# Altium project Main_PCB_v1.0.PrjPcb
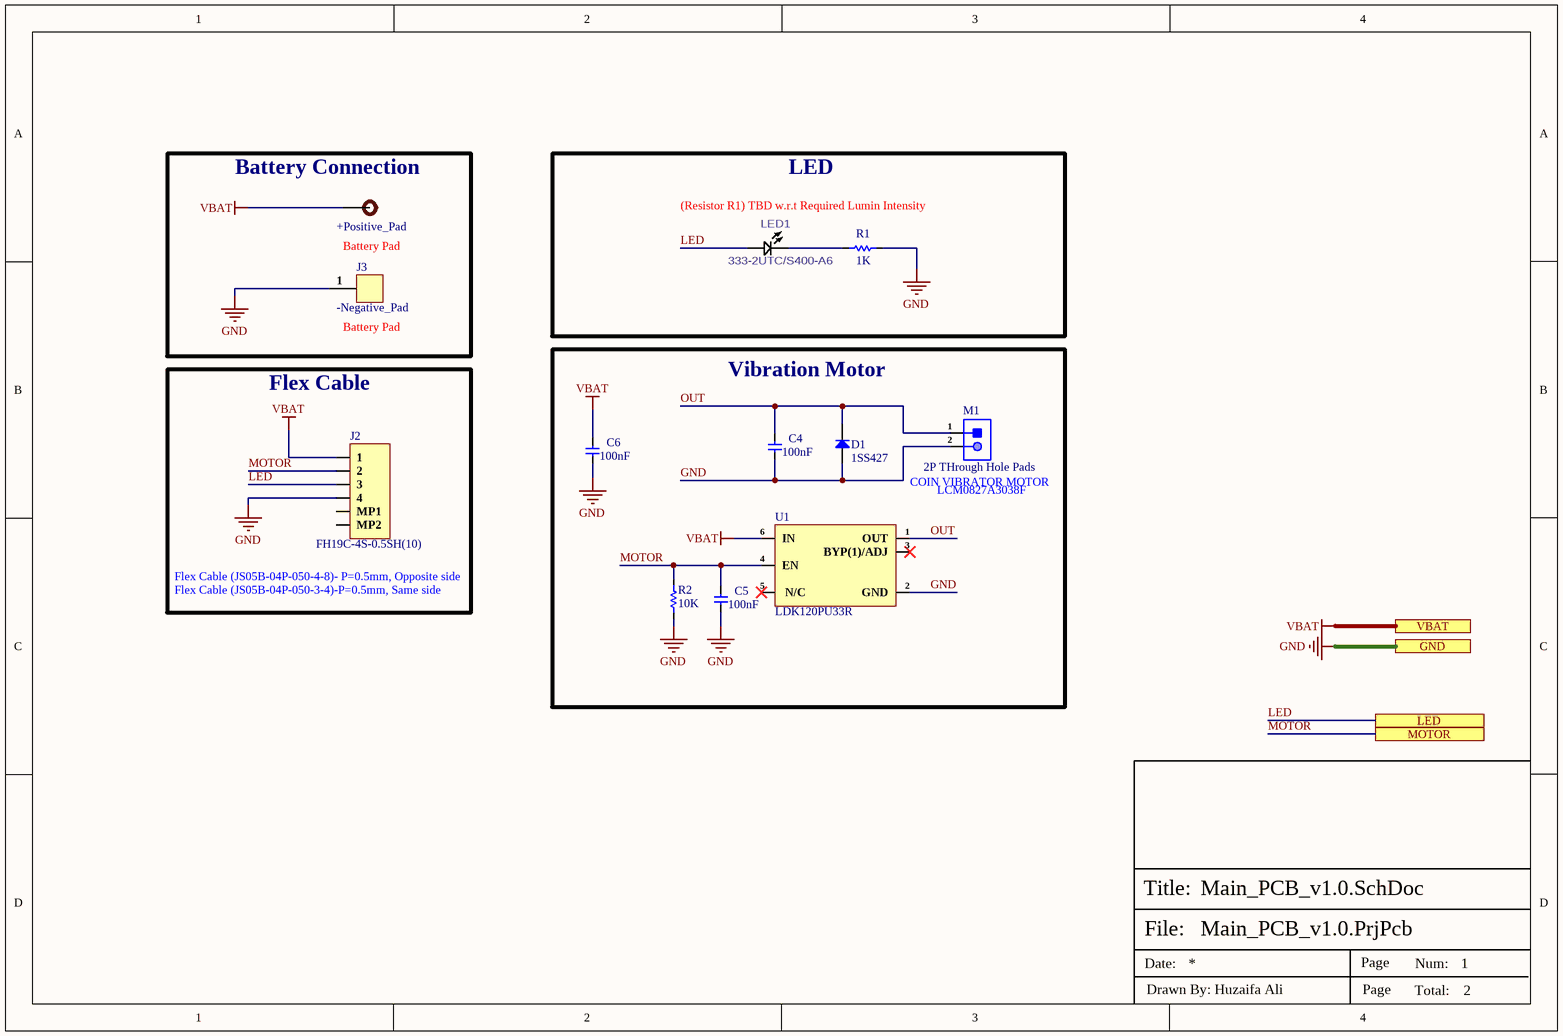
[diagram p0: Main_PCB_v1.0.SchDoc]
1 sheet, 12 parts. Net scope: flat (ports and power ports of the same name join across sheets).
Board file: Main_PCB_v1.0.PcbDoc

## Sheet Main_PCB_v1.0.SchDoc
size A4; SheetNumber: 1; SheetTotal: 2

### Parts
?  +Positive_Pad  [Test-point]
C4  100nF  [CAP-0201]
C5  100nF  [CAP-0201]
C6  100nF  [CAP-0201]
D1  1SS427  [SOD-923.]
J2  FH19C-4S-0.5SH(10)  [FH19C-4S-0.5SH(10)]
J3  -Negative_Pad  [Through Hole Pad (High Power)_]
LED1  333-2UTC/S400-A6  [LED BEND]
M1  2P THrough Hole Pads  [2P THrough Hole Pads]
R1  1K  [Res-0603]
R2  10K  [Res-0201]
U1  LDK120PU33R  [6-DFN (1.2x1.3)]

### Blocks framed on the sheet
Battery Connection: ? J3
LED: LED1 R1
Vibration Motor: C4-C6 D1 M1 R2 U1
Flex Cable: J2

### Ports
GND, LED, MOTOR, VBAT

### Nets
GND: C4.1 C5.1 C6.1 D1.2(A) J2.4 J3.1 M1.2 R1.2 R2.1 U1.2(GND) ; port GND
VBAT: ?.1 C6.2 J2.1 U1.6(IN) ; port VBAT
LED: J2.3 LED1.2(+) ; port LED
MOTOR: C5.2 J2.2 R2.2 U1.4(EN) ; port MOTOR
OUT: C4.2 D1.1(K) M1.1 U1.1(OUT)
NetLED1_1: LED1.1(-) R1.1

Not connected (* = marked no-connect by the designer): J2 MP1 MP2; U1 3(BYP(1)/ADJ)* 5(_N/C)*

### Notes on the sheet
- (near J3) Battery Pad
- (Resistor R1) TBD w.r.t Required Lumin Intensity
- (near M1) COIN VIBRATOR MOTOR
- LCM0827A3038F
- (near J2) Flex Cable (JS05B-04P-050-4-8)- P=0.5mm, Opposite side
- Flex Cable (JS05B-04P-050-3-4)-P=0.5mm, Same side
- File:
- Title:
- Date:
- Page
- Num:
- Total:
- Drawn By: Huzaifa Ali

### Library data of the parts
? = TEST POINT: Test Point ON; Item Type: TEST POINT
C4-C6 = CC0201KRX5R6BB104: CAP CER 0.1UF 10V X5R 0201; Manufacturer: Yageo; Tolerance: 10%; Supplier 1: Mouser; Manufacturer Part Number: CC0201KRX5R6BB104; RoHS: Yes; Category: Ceramic Capacitors; Stock 1: 824403; Pricing 1: 1=0.10000, 10=0.02400, 50=0.02400, 100=0.01900, 1000=0.01100, 10000=0.00900 (USD); Mount: Surface Mount; Case/Package: 0201; Case Code (Imperial): 0201; Case Code (Metric): 0603; Weight: 6E-06oz; Min Operating Temperature: -55°C; Max Operating Temperature: 85°C; Capacitance: 100nF; Packaging: Tape and Reel; Voltage Rating: 10V; Dielectric: X5R; Termination: SMD/SMT; Voltage Rating (DC): 10V; Length: 0.6mm; Width: 0.012inch; Thickness: 0.013inch; Lead Free: Lead Free; Halogen Free: Halogen Free; ComponentLink1URL: https://datasheet.ciiva.com/11587/upy-gphc-x5r-4v-to-50v-12-11587190.pdf?src-supplier=Avnet; ComponentLink1Description: https://datasheet.ciiva.com/11587/upy-gphc-x5r-4v-to-50v-12-11587190.pdf?src-supplier=Avnet; Supplier Part Number 1: 603-CC201KRX5R6BB104; LCSC Part Number: C190183; Resistor Type: Ceramic; Series: CC; Construction: Flat; Height: 0.3mm; Depth: 0.3mm; Radiation Hardening: No; RoHS Compliant: Yes
D1 = 1SS427,L3M: DIODE GEN PURP 80V 100MA SOD923; Manufacturer: Toshiba; Reverse Recovery Time: 1.6ns; Max Repetitive Reverse Voltage (Vrrm): 85V; Peak Non-Repetitive Surge Current: 1A; Item Type: Switching Diode; Supplier 1: Arrow Electronics; Manufacturer Part Number: 1SS427,L3M; RoHS: Yes; Category: Rectifier Diodes; Stock 1: 22801; Pricing 1: 1=0.2509, 10=0.2033, 25=0.2013, 100=0.1061, 250=0.105, 500=0.0686, 1000=0.0432, 3000=0.0383, 6000=0.0352, 15000=0.0296 (USD); Mounting Technology: Surface Mount; Case/Package: SOD; Min Operating Temperature: -55°C; Max Operating Temperature: 150°C; Packaging: Cut Tape; Forward Current: 100mA; Average Rectified Current: 100mA; Max Reverse Voltage (DC): 80V; Series: -; RoHS Compliant: Yes; ComponentLink1URL: http://www.mouser.com/ds/2/408/1SS427_datasheet_en_20140708-708354.pdf?src-supplier=Mouser; ComponentLink1Description: http://www.mouser.com/ds/2/408/1SS427_datasheet_en_20140708-708354.pdf?src-supplier=Mouser; ComponentLink2URL: https://toshiba.semicon-storage.com/info/docget.jsp?did=11149&prodName=1SS427&src-supplier=Digi-Key; ComponentLink2Description: https://toshiba.semicon-storage.com/info/docget.jsp?did=11149&prodName=1SS427&src-supplier=Digi-Key; ComponentLink3URL: https://www.toshiba.com/taec/components2/datasheet_Sync/200802/DST_1SS427-TDE_EN_27790.pdf?src-supplier=Avnet; ComponentLink3Description: https://www.toshiba.com/taec/components2/datasheet_Sync/200802/DST_1SS427-TDE_EN_27790.pdf?src-supplier=Avnet; Supplier Part Number 1: 1SS427,L3M; LCSC Part Number: C146351
J2 = FH19C-4S-0.5SH(10): CONN FFC BOTTOM 4POS 0.5MM R/A; Manufacturer: Hirose; Actuator Material: Polymer,Polyphenylene,Liquid Crystal Polymer; Voltage Rating: 50V; Current Rating: 500mA; Number of Positions: 4; Insulation Resistance: 500MR; Wire/Cable Type: Flat Flex; Pitch: 0.02inch; Item Type: FPC Connector; Supplier 1: Digi-Key; Manufacturer Part Number: FH19C-4S-0.5SH(10); RoHS: Yes; Category: FFC / FPC; Stock 1: 7956; Pricing 1: 1=1.08, 10=0.916, 25=0.878, 50=0.8596, 100=0.8221, 250=0.7474, 500=0.67266, 1000=0.59792, 2500=0.54186 (USD); Mounting Technology: Surface Mount; Contact Material: Bronze; Contact Plating: Gold; Housing Material: Polymer; Min Operating Temperature: -55°C; Max Operating Temperature: 85°C; Packaging: Tape and Reel; Package Quantity: 5000; Termination: Solder; Series: FH19C; Flammability Rating: UL94 V-0; RoHS Compliant: Yes; ComponentLink1URL: https://datasheet.ciiva.com/18563/ed-fh19cfh19sc-20140305-18563548.pdf?src-supplier=Digi-Key; ComponentLink1Description: https://datasheet.ciiva.com/18563/ed-fh19cfh19sc-20140305-18563548.pdf?src-supplier=Digi-Key; Supplier Part Number 1: H125822CT-ND; LCSC Part Number: C424650
J3 = Through_Hole_Pad: Wire Connecting Pad
LED1 = 333-2UTC/S400-A6: Colorless transparence -40℃~+85℃ White light 15° 100mW Plugin,D=5mm Light Emitting Diodes (LED) ROHS; Manufacturer: Everlight Elec; Item type: LED; LCSC Part Number: C99695; Manufacturer Part Number: 333-2UTC/S400-A6; Package: Plugin,D=5mm; JLCPCB Part Class: Extended Part
M1 = 2P THrough Hole Pads: Wire Connecting Pad; Manufacturer Part Number: 2P THrough Hole Pads; Item Type: THrough Hole Pads
R1 = RC0603FR-071KL: RES SMD 1K OHM 1% 1/10W 0603; Manufacturer: Yageo; Temperature Coefficient: 100ppm/°C; Item type: Resistor; Resistance: 1kR; Power Rating: 100mW; Voltage Rating: 50V; Supplier 1: Digi-Key; Manufacturer Part Number: RC0603FR-071KL; Stock 1: 21472395; Pricing 1: 1=0.1, 10=0.023, 100=0.0094, 1000=0.0042, 2500=0.0037 (USD); Supplier Part Number 1: 311-1.00KHRDKR-ND; LCSC Part Number: C22548; Case/Package: 0603; Min Operating Temperature: -55°C; Max Operating Temperature: 155°C; Tolerance: 1%; Packaging: Tape and Reel; Termination: SMD/SMT; ComponentLink1URL: https://www.verical.com/server-webapp/html/getDatasheet?partID=409289&src-supplier=Verical; ComponentLink1Description: https://www.verical.com/server-webapp/html/getDatasheet?partID=409289&src-supplier=Verical; ComponentLink2URL: http://documents.rs-components.com/techlib://itc_doclist_GB.htm?stockno=5048928&src-supplier=RSComponents; ComponentLink2Description: http://documents.rs-components.com/techlib://itc_doclist_GB.htm?stockno=5048928&src-supplier=RSComponents; ComponentLink3URL: http://www.yageo.com/documents/recent/PYu-RC0603_51_RoHS_L_4.pdf?src-supplier=Avnet+Europe; ComponentLink3Description: http://www.yageo.com/documents/recent/PYu-RC0603_51_RoHS_L_4.pdf?src-supplier=Avnet+Europe; ComponentLink4URL: http://www.farnell.com/datasheets/2167052.pdf?src-supplier=Element14; ComponentLink4Description: http://www.farnell.com/datasheets/2167052.pdf?src-supplier=Element14; ComponentLink5URL: http://www.farnell.com/datasheets/1868787.pdf?src-supplier=Element14; ComponentLink5Description: http://www.farnell.com/datasheets/1868787.pdf?src-supplier=Element14; ComponentLink6URL: http://www.yageo.com/documents/recent/PYu-RC_Group_51_RoHS_L_2.pdf?src-supplier=Avnet; ComponentLink6Description: http://www.yageo.com/documents/recent/PYu-RC_Group_51_RoHS_L_2.pdf?src-supplier=Avnet; ComponentLink7URL: https://www.verical.com/server-webapp/html/getDatasheet?partID=404327&src-supplier=Verical; ComponentLink7Description: https://www.verical.com/server-webapp/html/getDatasheet?partID=404327&src-supplier=Verical; ComponentLink8URL: http://www.farnell.com/datasheets/443971.pdf?src-supplier=Element14; ComponentLink8Description: http://www.farnell.com/datasheets/443971.pdf?src-supplier=Element14; Contact Plating: Tin,Matte; Case Code (Imperial): 0603; Case Code (Metric): 1608; Composition: Thick Film; Military Standard: Not; Length: 1.6mm; Height: 0.45mm; Depth: 0.8mm; Radiation Hardening: No; REACH SVHC: No SVHC; Lead Free: Lead Free
R2 = RC0201JR-0710KL: RES SMD 10K OHM 5% 1/20W 0201; Manufacturer: Yageo; Resistance: 10kR; Temperature Coefficient: 200ppm/°C; Power Rating: 50mW; Voltage Rating: 25V; ComponentLink1URL: *; ComponentLink1Description: New link; ComponentLink2URL: https://datasheet.ciiva.com/8891/pyu-rc0201-51-rohs-l-8-8891388.pdf?src-supplier=Avnet; ComponentLink2Description: https://datasheet.ciiva.com/8891/pyu-rc0201-51-rohs-l-8-8891388.pdf?src-supplier=Avnet; Supplier 1: Digi-Key; Manufacturer Part Number: RC0201JR-0710KL; Stock 1: 1488597; Pricing 1: 1=0.10000, 10=0.02600, 100=0.01050, 1000=0.00472, 2500=0.00410, 5000=0.00338 (USD); Case/Package: 0201; Case Code (Imperial): 0201; Case Code (Metric): 0603; Min Operating Temperature: -55°C; Max Operating Temperature: 125°C; Tolerance: 5%; Packaging: Tape and Reel; Resistor Type: Thick Film; Termination: SMD/SMT; Voltage Rating (DC): 25V; Length: 0.6mm; Depth: 0.3mm; REACH SVHC: Unknown; ComponentLink3URL: https://datasheet.ciiva.com/7672/1563626-7672253.pdf?src-supplier=Element14; ComponentLink3Description: https://datasheet.ciiva.com/7672/1563626-7672253.pdf?src-supplier=Element14; Supplier Part Number 1: 311-10KNCT-ND; LCSC Part Number: C138117; Category: Chip SMD Resistors; Contact Plating: Tin,Matte; Lead Free: Lead Free; Military Standard: Not; Radiation Hardening: No; RoHS: Yes; ComponentLink4URL: https://datasheet.ciiva.com/28405/pyu-rc0201-51-rohs-l-8-28405613.pdf?src-supplier=Avnet+Europe; ComponentLink4Description: https://datasheet.ciiva.com/28405/pyu-rc0201-51-rohs-l-8-28405613.pdf?src-supplier=Avnet+Europe; ComponentLink5URL: https://datasheet.ciiva.com/7672/1563626-7672254.pdf?src-supplier=Element14; ComponentLink5Description: https://datasheet.ciiva.com/7672/1563626-7672254.pdf?src-supplier=Element14; ComponentLink6URL: https://datasheet.ciiva.com/7660/1421516-7660810.pdf?src-supplier=Element14; ComponentLink6Description: https://datasheet.ciiva.com/7660/1421516-7660810.pdf?src-supplier=Element14; ComponentLink7URL: https://datasheet.ciiva.com/16856/pyu-rc0201-51-rohs-l-8-16856011.pdf?src-supplier=Avnet+Europe; ComponentLink7Description: https://datasheet.ciiva.com/16856/pyu-rc0201-51-rohs-l-8-16856011.pdf?src-supplier=Avnet+Europe; ComponentLink8URL: https://datasheet.ciiva.com/46391/1421516-46391291.pdf?src-supplier=Element14; ComponentLink8Description: https://datasheet.ciiva.com/46391/1421516-46391291.pdf?src-supplier=Element14
U1 = LDK120PU33R: IC REG LINEAR 3.3V 200MA 6DFN; Manufacturer: STMicroelectronics; Number of Outputs: 1; Min Input Voltage: 1.9V; Max Supply Voltage: 5.5V; Dropout Voltage: 150mV; Polarity: Positive; Quiescent Current: 60uA; Accuracy: 2%; Operating Supply Current: 50uA; Power Supply Rejection Ratio (PSRR): 55dB; Output Type: Fixed; Supplier 1: Mouser; Manufacturer Part Number: LDK120PU33R; RoHS: Yes; Category: Voltage Regulators - Linear; Stock 1: 1169; Pricing 1: 1=0.91, 10=0.752, 50=0.752, 100=0.614, 1000=0.388, 10000=0.343 (USD); Mounting Technology: Surface Mount; Case/Package: DFN; Pins: 6; Min Operating Temperature: -40°C; Max Operating Temperature: 125°C; Packaging: Tape and Reel; Max Output current: 200mA; Output Voltage: 3.3V; Output Current: 200mA; Number of Regulators: 1; Nominal Output Voltage: 3.3V; Package Quantity: 6000; Series: -; Length: 1.3mm; Width: 1.2mm; Height: 0.45mm; Radiation Hardening: No; Reach SVHC Compliant: No; Lead Free: Lead Free; RoHS Compliant: Yes; ComponentLink1URL: https://datasheet.ciiva.com/48475/dm00070790-48475005.pdf?src-supplier=Avnet; ComponentLink1Description: https://datasheet.ciiva.com/48475/dm00070790-48475005.pdf?src-supplier=Avnet; Supplier Part Number 1: 511-LDK120PU33R; LCSC Part Number: C2971162; Item Type: IC